# EAGLE design SEEED_WIO_LR2021 (EAGLE 6.5.0)
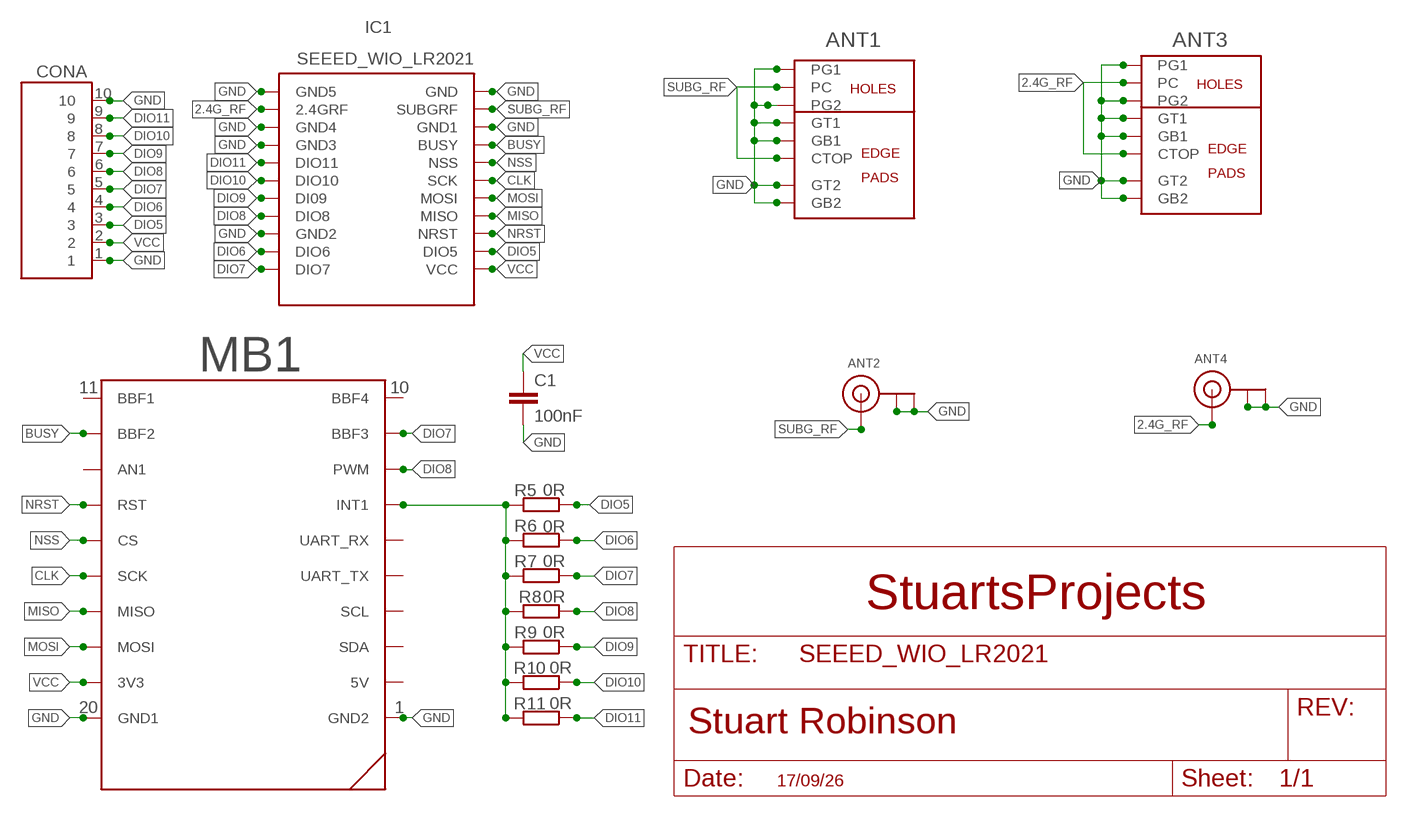
[diagram p0: schematic, sheet 1]

## Parts
ANT1  CUSTOMSMA  [CUSTOMSMA]
ANT2  ANTENNA_U.FL  [U.FL]
ANT3  CUSTOMSMA  [CUSTOMSMA]
ANT4  ANTENNA_U.FL  [U.FL]
C1  100nF  C-EUC0805  [C0805]
CONA  10X1  [10X1]
IC1  SEEED_WIO_LR2021  SEEED_WIO_LR2021_DEFAULT  [LR2021_SEEED]
MB1  BBFRIENDY2  [PCB_SOCKET_BBFRIENDLY2]
R5  0R  R-EU_R0805  [R0805]
R6  0R  R-EU_R0805  [R0805]
R7  0R  R-EU_R0805  [R0805]
R8  0R  R-EU_R0805  [R0805]
R9  0R  R-EU_R0805  [R0805]
R10  0R  R-EU_R0805  [R0805]
R11  0R  R-EU_R0805  [R0805]

## Nets
2.4G_RF: ANT3.CTOP ANT3.PC ANT4.3(SIGNAL) IC1.P$13(2.4GRF)
BUSY: IC1.P$8(BUSY) MB1.BBF2
CLK: IC1.P$6(SCK) MB1.SCK
DIO5: CONA.3 IC1.P$2(DIO5) R5.1
DIO6: CONA.4 IC1.P$21(DIO6) R6.1
DIO7: CONA.5 IC1.P$22(DIO7) MB1.BBF3 R7.1
DIO8: CONA.6 IC1.P$19(DIO8) MB1.PWM R8.1
DIO9: CONA.7 IC1.P$18(DI09) R9.1
DIO10: CONA.8 IC1.P$17(DIO10) R10.1
DIO11: CONA.9 IC1.P$16(DIO11) R11.1
GND [VDD]: ANT1.G1 ANT1.G2 ANT1.GB1 ANT1.GB2 ANT1.GT1 ANT1.GT2 ANT2.1(GND) ANT2.2(GND) ANT3.G1 ANT3.G2 ANT3.GB1 ANT3.GB2 ANT3.GT1 ANT3.GT2 ANT4.1(GND) ANT4.2(GND) C1.2 CONA.1 CONA.10 IC1.P$9(GND1) IC1.P$11(GND) IC1.P$12(GND5) IC1.P$14(GND4) IC1.P$15(GND3) IC1.P$20(GND2) MB1.GND1(GND2) MB1.GND2(GND1)
IRQ: MB1.INT(INT1) R5.2 R6.2 R7.2 R8.2 R9.2 R10.2 R11.2
MISO: IC1.P$4(MISO) MB1.MISO
MOSI: IC1.P$5(MOSI) MB1.MOSI
NRST: IC1.P$3(NRST) MB1.RST
NSS: IC1.P$7(NSS) MB1.CS
SUBG_RF: ANT1.CTOP ANT1.PC ANT2.3(SIGNAL) IC1.P$10(SUBGRF)
VCC [VDD]: C1.1 CONA.2 IC1.P$1(VCC) MB1.3V3
Unconnected: MB1.5V MB1.AN1 MB1.BBF1 MB1.BBF4 MB1.RX(UART_RX) MB1.SCL MB1.SDA MB1.TX(UART_TX)

## Notes on the sheet
- 11 | 10
- StuartsProjects
- 20 | 1
- 17/09/26

## Library data of the parts
ANT1 ANT3 = con-coax:CUSTOMSMA
ANT2 ANT4 = adafruit:ANTENNA_U.FL: U.FL Antenna Connector
C1 = resistor:C-EU: CAPACITOR, European symbol
CONA = My_Pin_Headers:10X1
IC1 = LMA2:SEEED_WIO_LR2021
MB1 = My_Mikrobus:BBFRIENDY2
R5-R11 = resistor:R-EU_: RESISTOR, European symbol

## Net classes
0 default: width 0.203 mm
1 POWER: width 0.635 mm
2 VDD: width 0.635 mm

## Board
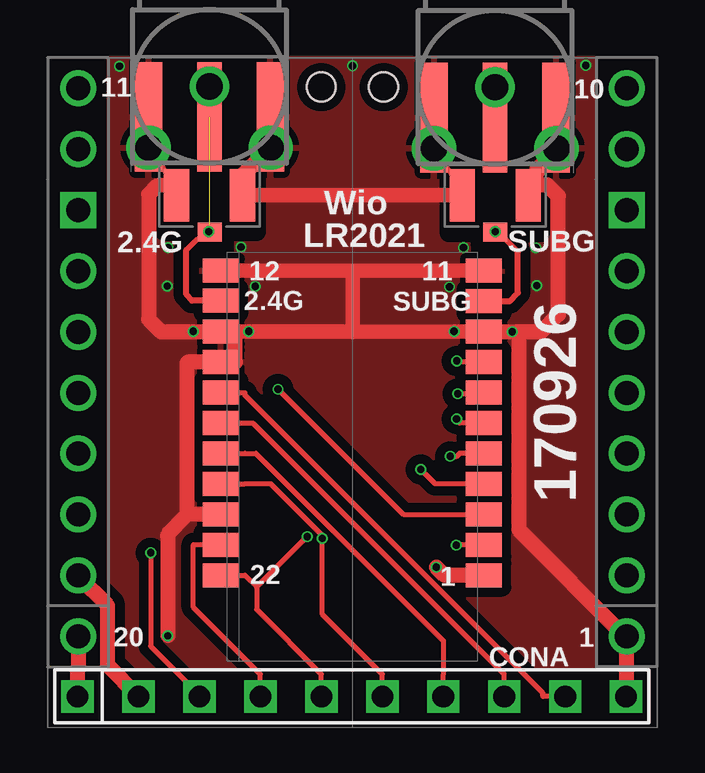
[diagram p1: board, top side]
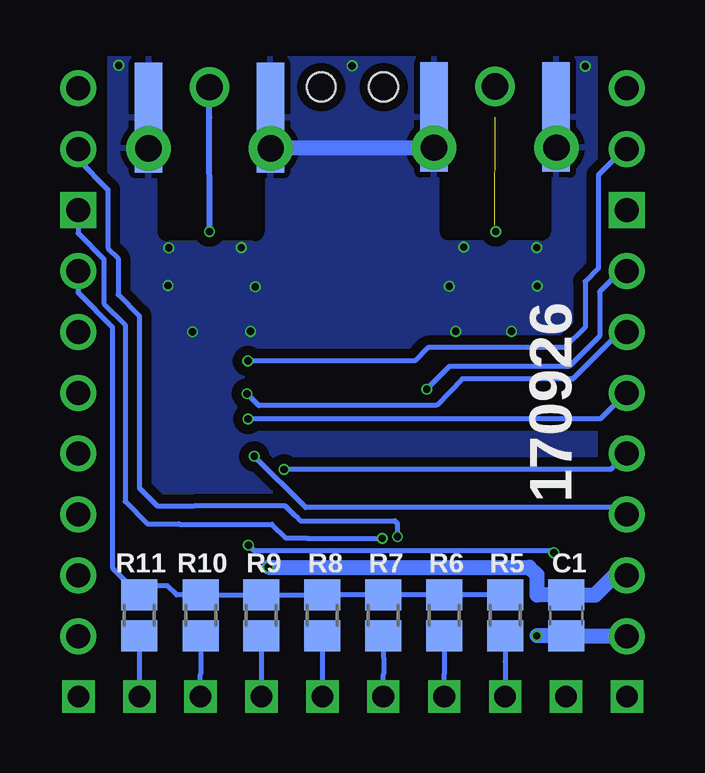
[diagram p2: board, bottom side, seen from below]

No outline drawn. Coordinates in mm, seen from the top.
Copper layers (1*16): Top 0.035559375mm / dielectric 1.6mm / Bottom 0.035559375mm
Design rules "jlcpcb2layer_Stuarts": minimum track width 5mil, minimum drill 12mil, track to track 6mil, track to pad 6mil, pad to pad 6mil, via to via 6mil, smd to smd 6mil, copper to edge 8mil, drill to drill 6mil, minimum pad ring 5mil, minimum via ring 3mil, stop-mask expansion 2.5mil, vias tented up to drill 1000mil, thermal gap 10mil
Holes 1.2 mm at 11.4,26.72 14,26.72
tRestrict: area 4.9,20.7 to 8.7,27.8; area 16.7,20.6 to 20.5,27.9; area 5.8,19.6 to 7.4,20.2; area 18,19.5 to 19.3,20.2; area 8,8.3 to 8.1,9.4
bRestrict: area -0.1,0.4 to 0,0.5; area 4.8,20.7 to 8.7,27.9; area 16.8,20.7 to 20.4,28; area 2,2 to 5.7,5

### Footprints (pad centres in the part's own frame; a part is rotated, then mirrored left to right if it is on the bottom)
CUSTOMSMA = smd 4.572 x 1.016: CTOP -1.27,0 | drill 1.1 pad 1.85: G1 -2.55,2.55; G2 -2.55,-2.55 | smd 4.572 x 1.143 bottom: GB1 -1.27,2.54; GB2 -1.27,-2.54 | smd 4.572 x 1.143: GT1 -1.27,2.54; GT2 -1.27,-2.54 | drill 1.1 pad 1.651: PC 0,0
U.FL = smd 2.2 x 1.05: 1 0,1.375; 2 0,-1.375 | smd 0.8 x 1: 3 1.525,0
C0805 = smd 1.3 x 1.5: 1 -0.85,0; 2 0.85,0
10X1 = drill 0.9 square: 1 -11.43,0; 2 -8.89,0; 3 -6.35,0; 4 -3.81,0; 5 -1.27,0; 6 1.27,0; 7 3.81,0; 8 6.35,0; 9 8.89,0; 10 11.43,0
LR2021_SEEED = smd 1.5 x 1: P$1 5.48,-4.94; P$2 5.48,-3.67; P$3 5.48,-2.4; P$4 5.48,-1.13; P$5 5.48,0.14; P$6 5.48,1.41; P$7 5.48,2.68; P$8 5.48,3.95; P$9 5.48,5.22; P$10 5.48,6.49; P$11 5.48,7.76; P$12 -5.48,7.76; P$13 -5.48,6.51; P$14 -5.48,5.22; P$15 -5.48,3.95; P$16 -5.48,2.68; P$17 -5.48,1.41; P$18 -5.48,0.14; P$19 -5.48,-1.13; P$20 -5.48,-2.4; P$21 -5.48,-3.67; P$22 -5.48,-4.94
PCB_SOCKET_BBFRIENDLY2 = drill 1: 3V3 1.27,6.35; 5V 24.13,6.35; BBF1 1.27,26.67; BBF2 1.27,24.13; BBF3 24.13,24.13; BBF4 24.13,26.67; CS 1.27,16.51; GND1 1.27,3.81; GND2 24.13,3.81; INT 24.13,19.05; MISO 1.27,11.43; MOSI 1.27,8.89; RST 1.27,19.05; RX 24.13,16.51; SCK 1.27,13.97; SCL 24.13,11.43; SDA 24.13,8.89; TX 24.13,13.97 | drill 1 square: AN1 1.27,21.59; PWM 24.13,21.59
R0805 = smd 1.3 x 1.5: 1 -0.85,0; 2 0.85,0

### Placement (x,y rotation side)
ANT1  18.65,26.71 90 top
ANT2  18.65,22.2 270 top
ANT3  6.75,26.74 90 top
ANT4  6.75,22.2 270 top
C1  3.79,4.69 270 bottom
CONA  12.68,1.31 0 top
IC1  12.7,11.3 0 top
MB1  0,0 0 top
R5  6.33,4.69 90 bottom
R6  8.88,4.69 90 bottom
R7  11.41,4.69 90 bottom
R8  13.95,4.69 90 bottom
R9  16.49,4.69 90 bottom
R10  19.02,4.69 90 bottom
R11  21.57,4.69 90 bottom

### Tracks (layer width: path | path; a pad name or v marks a point on that pad's centre or on a via)
2.4G_RF  (via drill 0.3 pad 0.45)  (1 unrouted)
  Top 0.203: ANT3.PC ANT3.CTOP | 6.48,20.68 6.48,20.48 6.37,20.37 6.24,20.37 5.79,19.92
  Top 0.254: IC1.P$13 6.01,17.81 5.79,18.07 5.79,19.92 | 6.48,20.68 6.76,20.96 6.73,20.62 v6.72,20.69 ANT4.3
BUSY  (via drill 0.3 pad 0.46)
  Top 0.203: v17.05,15.3 17.13,15.3 17.18,15.25 IC1.P$8
  Bottom 0.203: v17.05,15.3 10.1,15.3 9.55,15.85 3.84,15.85 3,16.69 3,18.61 2.45,19.16 2.45,23.05 1.37,24.13 MB1.BBF2
CLK  (via drill 0.3 pad 0.45)
  Top 0.203: v17.04,12.88 17.18,12.75 17.18,12.71 IC1.P$6
  Bottom 0.203: MB1.SCK 2.36,12.88 v17.04,12.88
DIO5  (via drill 0.3, 0.3 pad 0.45)
  Top 0.203: IC1.P$2 17.18,7.63 17.16,7.62 v17.03,7.62 | v4.3,7.3 4.3,3.4 6.3,1.4 CONA.3
  Bottom 0.203: CONA.3 6.33,2.76 R5.1 | v17.03,7.62 16.79,7.38 4.3,7.38 v4.3,7.3
DIO6
  Top 0.203: IC1.P$21 6.08,7.63 6.08,5.03 8.87,2.24 CONA.4
  Bottom 0.203: CONA.4 8.87,2.24 8.88,2.25 R6.1
DIO7  (via drill 0.3 pad 0.45)
  Top 0.203: 8.71,5.87 8.71,4.93 11.41,2.24 CONA.5 | v10.82,7.97 8.71,5.87 | 8.71,5.87 8.22,6.36 IC1.P$22
  Bottom 0.203: R7.1 11.41,2.94 11.4,2.93 11.4,2.25 11.41,2.24 CONA.5 | MB1.BBF3 24.13,23.68 22.89,22.44 22.89,20.12 22.89,20.01 22.46,19.58 22.46,18.06 21.57,17.17 21.57,10 20.82,9.25 19.29,9.25 15.49,9.25 15.07,8.83 15.06,8.83 14.86,8.63 10.93,8.63 10.82,8.52 v10.82,7.97
DIO8  (via drill 0.3 pad 0.45)
  Top 0.203: CONA.6 13.95,2.24 11.45,4.74 v11.45,7.9 11.45,8.02 9.3,10.17 8.22,10.17 IC1.P$19
  Bottom 0.203: v11.45,7.9 14.57,7.9 14.58,7.91 15.47,7.91 16.05,8.49 19.9,8.49 19.92,8.51 21.25,8.51 22.17,9.43 22.17,16.81 23.05,17.69 23.05,19.54 24.13,20.62 MB1.PWM | R8.1 CONA.6
DIO9
  Top 0.203: IC1.P$18 8.22,11.44 8.68,11.44 16.49,3.63 16.49,2.24 CONA.7
  Bottom 0.203: R9.1 CONA.7
DIO10
  Top 0.203: IC1.P$17 8.56,12.71 19.03,2.24 CONA.8
  Bottom 0.203: CONA.8 19.03,2.24 19.02,2.25 R10.1
DIO11
  Top 0.203: IC1.P$16 8.22,13.98 8.22,13.87 20.64,1.45 20.64,1.31 CONA.9
  Bottom 0.203: R11.1 CONA.9
GND  (via drill 0.3, 0.3 pad 0.45)
  Top 0.203: 4.57,23.82 4.59,23.82 ANT4.2 | ANT2.2 16.75,23.25 16.43,23.61 16.11,23.87 ANT1.G1
  Top 0.254: ANT2.1 20.43,23.09 | ANT1.GB1 16.16,24.8 | 4.57,23.82 ANT3.G1 4.16,25.46 ANT3.GB1 | ANT1.GB2 21.29,24.17 ANT1.G2 20.83,23.75 | 5.36,22.62 5.38,22.62 ANT4.2
  Top 0.61: 12.72,16.52 7.83,16.52 | 8.13,23.07 ANT4.1 | IC1.P$9 16.97,16.52 12.72,16.51 12.72,16.52 | 12.7,19.06 12.7,19.04 12.72,19.05 12.72,16.52 | 12.7,19.06 IC1.P$11 | IC1.P$12 12.73,19.07 12.7,19.06
  Top 0.635: v5.01,3.84 5.01,7.91 5.01,8.06 5.83,8.9 | 5.83,8.9 5.83,15.25 IC1.P$15 7.83,15.25 7.83,16.52 IC1.P$14 4.72,16.52 4.21,17.03 4.21,22.25 4.56,22.6 5.36,22.62 | IC1.P$20 5.83,8.9 | CONA.1 1.25,2.46 1.27,2.48 MB1.GND1 | 8.13,23.07 8.15,23.07 ANT3.G2 | ANT3.G2 ANT3.GB2 | ANT3.G2 | 19.64,16.52 19.64,8.25 24.07,3.8 24.1,3.8 | 16.16,24.8 16.3,24.66 16.3,24.36 ANT1.G1 | 19.64,16.52 20.58,16.52 21.29,17.22 21.29,22.18 20.83,22.63 19.99,22.62 ANT2.1 20.4,23.2 20.4,23.3 20.8,23.7 ANT1.G2 | 24.1,3.8 MB1.GND2 | IC1.P$9 19.64,16.52 | ANT2.2 8.15,22.22 8.17,22.95 8.17,23.04 8.14,23.07 | 7.93,22.7 7.93,22.8 ANT4.1 7.97,22.51 | 5.57,22.51 ANT4.2 | 24.1,3.8 24.11,3.8 CONA.10
  Bottom 0.635: v5.01,3.84 C1.2 1.3,3.84 MB1.GND1 | ANT3.GB2 ANT3.G2 16.1,24.19 | ANT1.G2 ANT1.GB2 | ANT1.GB1 16.11,24.2 16.1,24.19 | ANT1.G1 16.1,24.19 | ANT3.G1 ANT3.GB1
  other vias: 5.02,20.02 8.06,20.05 6.07,16.53 8.39,16.53 4.99,18.42 8.66,18.41 17.33,20.02 20.35,20.01 16.75,18.39 20.38,18.44 16.94,16.53 19.36,16.51 3,27.59 12.71,27.6 22.43,27.62
  pour Top (isolate 0.4): 2.53,27.94 22.86,27.94 22.86,2.43 2.53,2.43
  pour Bottom (isolate 0.4): 2.54,27.94 22.85,27.94 22.85,2.43 2.54,2.43
IRQ
  Bottom 0.203: R5.2 R6.2 R7.2 R8.2 R9.2 R10.2 20.02,5.54 20.41,5.92 21.57,5.92 R11.2 22.7,6.67 22.7,16.71 24.13,18.14 24.13,18.17 MB1.INT
MISO  (via drill 0.3 pad 0.45)
  Top 0.203: v15.55,10.77 16.15,10.17 17.18,10.17 IC1.P$4
  Bottom 0.203: MB1.MISO 1.93,10.77 v15.55,10.77
MOSI  (via drill 0.3 pad 0.45)
  Top 0.203: v16.79,11.32 17.06,11.32 17.18,11.44 IC1.P$5
  Bottom 0.203: MB1.MOSI 1.57,9.19 14.65,9.19 v16.79,11.32
NRST  (via drill 0.3 pad 0.45)
  Top 0.203: v9.6,14.12 14.82,8.9 IC1.P$3
  Bottom 0.203: MB1.RST 1.53,19.05 2.4,18.18 2.4,16.34 3.67,15.07 8.65,15.07 v9.6,14.12
NSS  (via drill 0.3)
  Top 0.203: v17.09,13.93 18.13,13.93 IC1.P$7
  Bottom 0.203: MB1.CS 1.55,16.51 3.52,14.54 8.13,14.55 9.19,13.45 16.59,13.43 v17.09,13.93
SUBG_RF  (via drill 0.3 pad 0.45)
  Top 0.203: ANT1.PC ANT1.CTOP | 18.63,20.76 18.63,20.7 ANT2.3 18.75,20.67 19.04,20.38 19.07,20.38 19.6,19.85
  Top 0.254: IC1.P$10 19.25,17.79 19.6,18.14 19.6,19.85 | 18.63,20.76 18.65,20.8 ANT2.3 v18.65,20.69
  Bottom 0.254: v18.65,20.69 ANT1.CTOP ANT1.PC
VCC  (via drill 0.3 pad 0.46)
  Top 0.635: v16.2,6.7 16.54,6.36 16.96,6.36 IC1.P$1 | CONA.2 2.5,2.6 2.5,5.1 1.3,6.3 MB1.3V3
  Bottom 0.635: MB1.3V3 1.76,6.35 2.57,5.54 C1.1 5.01,5.54 5.01,6.39 5.32,6.7 v16.2,6.7

### Text on the board
tPlace: 170926
bPlace: 170926
tNames: 11 | 10 | Wio | 2.4G | LR2021 | SUBG | 20 | CONA | 1
bNames: C1 | R5 | R6 | R7 | R8 | R9 | R10 | R11